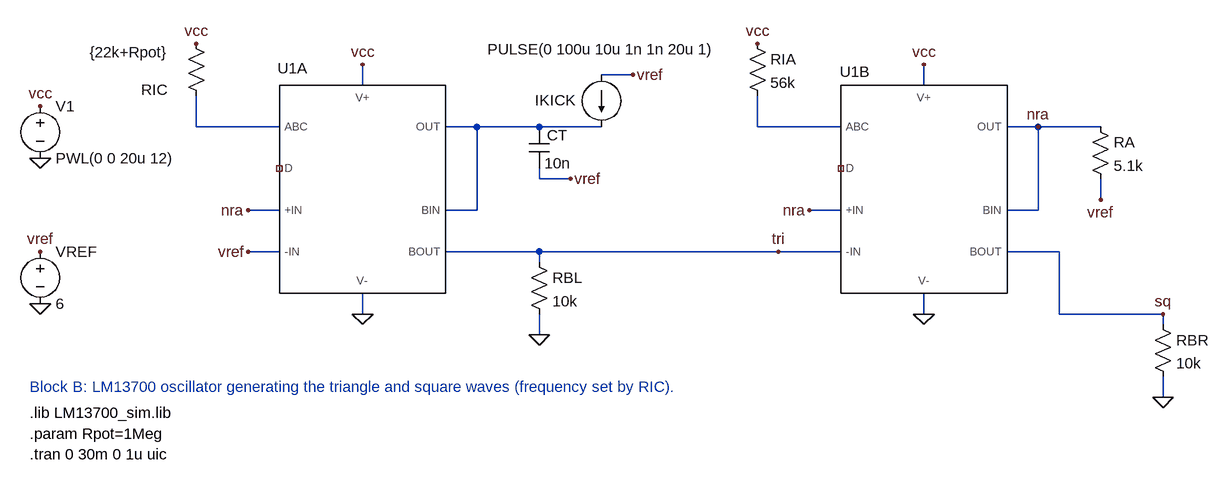
[diagram p0: schematic blockB_v4.asc]
blockB_v4.asc, the LTspice schematic file:
Version 4.1
SHEET 1 1800 760
WIRE 784 16 736 16
WIRE 368 32 368 0
WIRE 1232 32 1232 0
WIRE 112 96 112 48
WIRE 240 96 112 96
WIRE 544 96 496 96
WIRE 640 96 544 96
WIRE 736 96 640 96
WIRE 976 96 976 48
WIRE 1104 96 976 96
WIRE 1408 96 1360 96
WIRE 1504 96 1408 96
WIRE 640 176 640 160
WIRE 688 176 640 176
WIRE 1504 208 1504 176
WIRE 240 224 192 224
WIRE 544 224 544 96
WIRE 544 224 496 224
WIRE 1104 224 1056 224
WIRE 1408 224 1408 96
WIRE 1408 224 1360 224
WIRE 240 288 192 288
WIRE 640 288 496 288
WIRE 1008 288 640 288
WIRE 1104 288 1008 288
WIRE 1440 288 1360 288
WIRE 640 304 640 288
WIRE 368 384 368 352
WIRE 1232 384 1232 352
WIRE 1440 384 1440 288
WIRE 1600 384 1440 384
WIRE 1600 400 1600 384
WIRE 640 416 640 384
WIRE 1600 512 1600 480
FLAG -128 64 vcc
FLAG -128 144 0
FLAG -128 288 vref
FLAG -128 368 0
FLAG 112 -32 vcc
FLAG 192 224 nra
FLAG 192 288 vref
FLAG 368 0 vcc
FLAG 368 384 0
FLAG 688 176 vref
FLAG 784 16 vref
FLAG 640 416 0
FLAG 1008 288 tri
FLAG 976 -32 vcc
FLAG 1056 224 nra
FLAG 1232 0 vcc
FLAG 1232 384 0
FLAG 1408 96 nra
FLAG 1504 208 vref
FLAG 1600 384 sq
FLAG 1600 512 0
SYMBOL voltage -128 48 R0
WINDOW 123 0 0 Left 0
WINDOW 39 0 0 Left 0
SYMATTR InstName V1
SYMATTR Value PWL(0 0 20u 12)
SYMBOL voltage -128 272 R0
WINDOW 123 0 0 Left 0
WINDOW 39 0 0 Left 0
SYMATTR InstName VREF
SYMATTR Value 6
SYMBOL res 96 -48 R0
WINDOW 0 -69 87 Left 2
WINDOW 3 -148 29 Left 2
SYMATTR InstName RIC
SYMATTR Value {22k+Rpot}
SYMBOL LM13700_v2 240 32 R0
WINDOW 0 -3 -26 Left 2
SYMATTR InstName U1A
SYMATTR Value LM13700_SIM
SYMBOL cap 624 96 R0
WINDOW 0 28 13 Left 2
SYMATTR InstName CT
SYMATTR Value 10n
SYMBOL current 736 16 R0
WINDOW 0 -40 39 Right 2
WINDOW 3 0 -24 Bottom 2
WINDOW 123 0 0 Left 0
WINDOW 39 0 0 Left 0
SYMATTR InstName IKICK
SYMATTR Value PULSE(0 100u 10u 1n 1n 20u 1)
SYMBOL res 624 288 R0
SYMATTR InstName RBL
SYMATTR Value 10k
SYMBOL res 960 -48 R0
SYMATTR InstName RIA
SYMATTR Value 56k
SYMBOL LM13700_v2 1104 32 R0
WINDOW 0 -1 -21 Left 2
SYMATTR InstName U1B
SYMATTR Value LM13700_SIM
SYMBOL res 1488 80 R0
SYMATTR InstName RA
SYMATTR Value 5.1k
SYMBOL res 1584 384 R0
SYMATTR InstName RBR
SYMATTR Value 10k
TEXT -144 496 Left 2 ;Block B: LM13700 oscillator generating the triangle and square waves (frequency set by RIC).
TEXT -144 536 Left 2 !.lib LM13700_sim.lib
TEXT -144 568 Left 2 !.param Rpot=1Meg
TEXT -144 600 Left 2 !.tran 0 30m 0 1u uic

The netlist it stands for:
* blockB_v4.asc
V1 vcc 0 PWL(0 0 20u 12)
VREF vref 0 6
RIC vcc N001 {22k+Rpot}
X§U1A N001 NC_01 nra vref N002 0 N002 tri vcc LM13700_SIM  ; pins ABC D +IN -IN OUT V- BIN BOUT V+
CT N002 vref 10n
IKICK vref N002 PULSE(0 100u 10u 1n 1n 20u 1)
RBL tri 0 10k
RIA vcc N003 56k
X§U1B N003 NC_02 nra tri nra 0 nra sq vcc LM13700_SIM  ; pins ABC D +IN -IN OUT V- BIN BOUT V+
RA nra vref 5.1k
RBR sq 0 10k
* Block B: LM13700 oscillator generating the triangle and square waves (frequency set by RIC).
.lib LM13700_sim.lib
.param Rpot=1Meg
.tran 0 30m 0 1u uic
.backanno
.end